# EasyEDA Pro project P3+KG.epro, schematic Schematic1
Board Name: Board1; Create Date: 2026-05-26; Page Name: P1; Project Name: P3; Schematic Name: Schematic1; Update Date: 2026-05-27; Company: 嘉立创EDA; Page Size: A4; Version: V1.0
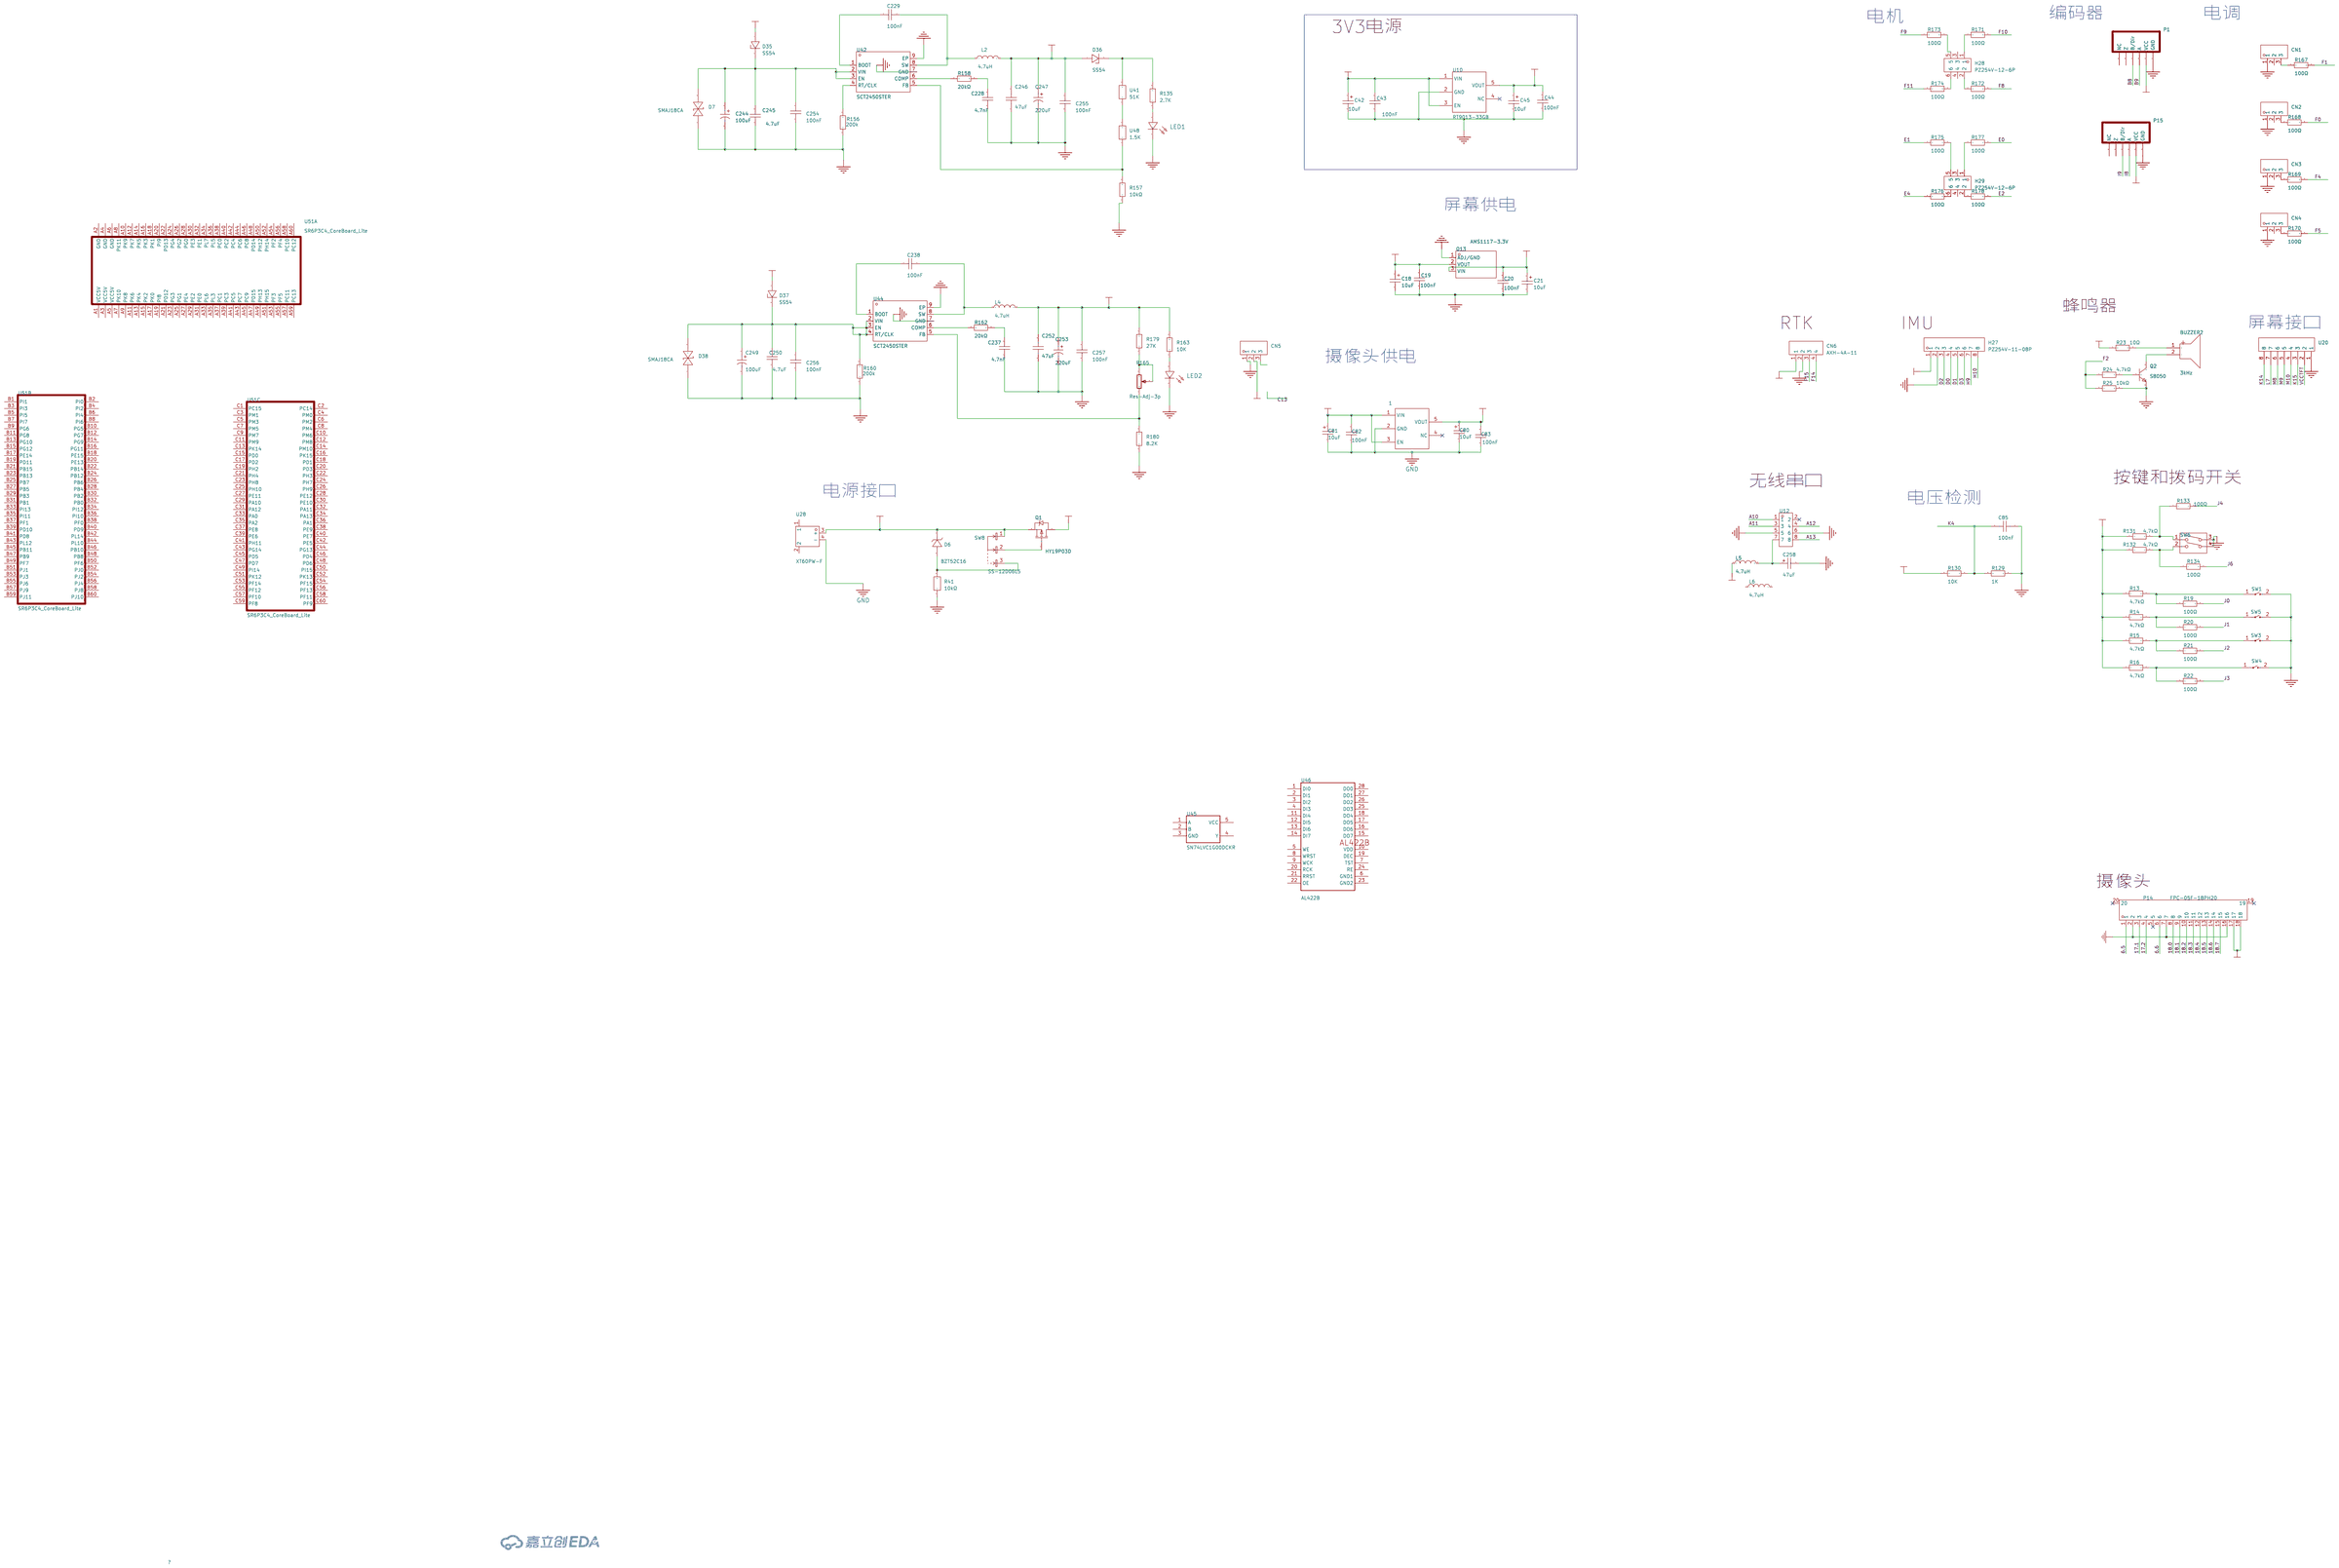
[diagram p0: schematic sheet]

## Parts
1  RT9013-33GB  [SOT-23-5_L3.0-W1.7-P0.95-LS2.8-BL]
BUZZER2  3kHz  [BUZ-TH_BD9.0-P5.00-D0.6-FD]
C18  10uF  [CAP-SMD_L3.2-W1.6-RD-C7171]
C19  100nF  [C0805]
C20  100nF  [C0805]
C21  10uF  [CAP-SMD_L3.2-W1.6-RD-C7171]
C42  10uF  [CAP-SMD_L3.2-W1.6-RD-C7171]
C43  100nF  [C0805]
C44  100nF  [C0805]
C45  10uF  [CAP-SMD_L3.2-W1.6-RD-C7171]
C80  10uF  [CAP-SMD_L3.2-W1.6-RD-C7171]
C81  10uF  [CAP-SMD_L3.2-W1.6-RD-C7171]
C82  100nF  [C0805]
C83  100nF  [C0805]
C85  100nF  [C0603]
C228  4.7nF  [C0603]
C229  100nF  [C0805]
C237  4.7nF  [C0603]
C238  100nF  [C0805]
C244  100uF  [CAP-TH_BD8.0-P3.50-D0.5-FD]
C245  4.7uF  [C1206]
C246  47uF  [C1206]
C247  220uF  [CAP-TH_BD6.3-P2.50-D0.5-FD]
C249  100uF  [CAP-TH_BD8.0-P3.50-D0.5-FD]
C250  4.7uF  [C1206]
C252  47uF  [C1206]
C253  220uF  [CAP-TH_BD6.3-P2.50-D0.5-FD]
C254  100nF  [C0805]
C255  100nF  [C0805]
C256  100nF  [C0805]
C257  100nF  [C0805]
C258  47uF  [CASE-B_3528]
CN1  ZX-XH2.54-3PZZ  [CONN-TH_3P-P2.54_2501S-3P]
CN2  ZX-XH2.54-3PZZ  [CONN-TH_3P-P2.54_2501S-3P]
CN3  ZX-XH2.54-3PZZ  [CONN-TH_3P-P2.54_2501S-3P]
CN4  ZX-XH2.54-3PZZ  [CONN-TH_3P-P2.54_2501S-3P]
CN5  ZX-XH2.54-3PZZ  [CONN-TH_3P-P2.54_2501S-3P]
CN6  AXH-4A-11  [CONN-TH_KH-XH-4A-Z]
D6  BZT52C16  [SOD-123_L2.7-W1.6-LS3.7-RD]
D7  SMAJ18CA  [SMA_L4.4-W2.6-LS5.0-BI]
D35  SS54  [SMA_L4.3-W2.6-LS5.0-FD]
D36  SS54  [SMA_L4.3-W2.6-LS5.0-FD]
D37  SS54  [SMA_L4.3-W2.6-LS5.0-FD]
D38  SMAJ18CA  [SMA_L4.4-W2.6-LS5.0-BI]
H27  PZ254V-11-08P  [HDR-TH_8P-P2.54-V-M]
H28  PZ254V-12-6P  [HDR-TH_6P-P2.54-V-M-R2-C3-S2.54]
H29  PZ254V-12-6P  [HDR-TH_6P-P2.54-V-M-R2-C3-S2.54]
L2  4.7uH  [IND-SMD_L7.3-W6.6_YSPI07XX]
L4  4.7uH  [IND-SMD_L7.3-W6.6_YSPI07XX]
L5  4.7uH  [IND-SMD_L4.6-W4.1-A]
L6  4.7uH  [IND-SMD_L2.5-W2.0_SLW252012P]
LED1  -  [LED_0603]
LED2  -  [LED_0603]
P1  GH1.25-6P  [ECD-GH1.25-6P-SV]
P14  FPC-05F-18PH20  [FPC-SMD_18P-P0.50_FPC-05F-18PH20]
P15  GH1.25-6P  [ECD-GH1.25-6P-SV]
Q1  HY19P03D  [TO-252-2_L6.6-W6.1-P4.57-LS9.9-TL-CW]
Q2  S8050  [SOT-23-3_L2.9-W1.3-P1.90-LS2.3-BR]
Q13  AMS1117-3.3V  [SOT-89-3_L4.5-W2.5-P1.50-LS4.2-BR]
R13  4.7kΩ  [R0603]
R14  4.7kΩ  [R0603]
R15  4.7kΩ  [R0603]
R16  4.7kΩ  [R0603]
R19  100Ω  [R0603]
R20  100Ω  [R0603]
R21  100Ω  [R0603]
R22  100Ω  [R0603]
R23  10Ω  [R0603]
R24  4.7kΩ  [R0603]
R25  10kΩ  [R0603]
R41  10kΩ  [R0603]
R129  1K  [R0603]
R130  10K  [R0603]
R131  4.7kΩ  [R0603]
R132  4.7kΩ  [R0603]
R133  100Ω  [R0603]
R134  100Ω  [R0603]
R135  2.7K  [R0603]
R156  200k  [R0603]
R157  10kΩ  [R0603]
R158  20kΩ  [R0603]
R160  200k  [R0603]
R162  20kΩ  [R0603]
R163  10K  [R0603]
R165  50K  [RESPOT3296W]
R167  100Ω  [R0603]
R168  100Ω  [R0603]
R169  100Ω  [R0603]
R170  100Ω  [R0603]
R171  100Ω  [R0603]
R172  100Ω  [R0603]
R173  100Ω  [R0603]
R174  100Ω  [R0603]
R175  100Ω  [R0603]
R176  100Ω  [R0603]
R177  100Ω  [R0603]
R178  100Ω  [R0603]
R179  27K  [R0603]
R180  8.2K  [R0603]
SW1  K2-1107ST-A1SW-06  [SW-SMD_L6.0-W3.6-LS8.0]
SW3  K2-1107ST-A1SW-06  [SW-SMD_L6.0-W3.6-LS8.0]
SW4  K2-1107ST-A1SW-06  [SW-SMD_L6.0-W3.6-LS8.0]
SW5  K2-1107ST-A1SW-06  [SW-SMD_L6.0-W3.6-LS8.0]
SW6  DSWB02LHGET  [SW-TH_DSWB02LHGET]
SW8  SS-12D06L5  [SW-TH_3P-P4.70_L11.1-W12.7]
U10  RT9013-33GB  [SOT-23-5_L3.0-W1.7-P0.95-LS2.8-BL]
U12  PM254-2-04-W-8.5  [HDR-TH_8P-P2.54-H-F-R2-C4-W8.5]
U20  -  [HDR-TH_8P-P2.54-V-F-1]
U28  XT60PW-F  [TH_2P-XT60PW-F]
U41  51K  [R0603]
U42  SCT2450STER  [ESOP-8_L4.9-W3.9-P1.27-LS6.0-BL-EP]
U44  SCT2450STER  [ESOP-8_L4.9-W3.9-P1.27-LS6.0-BL-EP]
U45  SN74LVC1G00DCKR  [SOT-353]
U46  AL422B  [SOP-28]
U48  1.5K  [R0603]
U51  SR6P3C4_CoreBoard_Lite  [SR6P3C4_CoreBoard_Lite]  (sections 1,2,3)

## Library data of the parts
1 = RT9013-33GB: 输出类型:固定;输出极性:正;输出通道数:1;最大输入电压:5.5V;输出电压:3.3V;压差:400mV@(500mA);静态电流(地电流):-;输出电流:500mA;电源纹波抑制比(PSRR):50dB@(10kHz);噪声:-;特性:-;; LCSC Part Name: 正 Vin=5.5V Vout=3.3V 500mA 50dB@(10kHz); Supplier Part: C47773; Manufacturer: RICHTEK(立锜); Supplier Footprint: SOT-23-5; JLCPCB Part Class: Extended Part; Datasheet: https://atta.szlcsc.com/upload/public/pdf/source/20150504/1457707282459.pdf; Supplier: LCSC; Output Type: 固定; Output Polarity: 正; Maximum Input Voltage: 5.5V; Output Voltage: 3.3V; Dropout Voltage: 400mV@(500mA); Output Current: 500mA; Power Supply Rejection Ratio (PSRR): 50dB@(10kHz)
BUZZER2 = HNB09A03: 驱动方式:有源(内含驱动线路);构造类型:电磁式;频率:3kHz;声压(SPL):85dB@10cm;; LCSC Part Name: 电磁式有源一体蜂鸣器HNB09A03; Supplier Part: C96102; Manufacturer: 华能; Supplier Footprint: 插件,D=9mm; JLCPCB Part Class: 扩展库; Datasheet: https://atta.szlcsc.com/upload/public/pdf/source/20170522/1495448326172.pdf; Supplier: LCSC; Oscillator Circuit: 有源(内含驱动线路); Technology Type: 电磁式; Operating Voltage: 1.5V~4.5V; Current Consumption: 30mA; Sound Pressure Level (SPL): 85dB@10cm; Diameter (φD): 9mm; Height: 5.5mm; Operating Temperature: -20℃~+70℃
C18 C21 C42 C45 C80 C81 = TAJA106K016RNJ: 容值:10uF;精度:±10%;额定电压:16V;等效串联电阻:3Ω@100kHz;; LCSC Part Name: 10uF ±10% 16V; Supplier Part: C7171; Manufacturer: Kyocera AVX; Supplier Footprint: CASE-A-3216; JLCPCB Part Class: 基础库; Datasheet: https://atta.szlcsc.com/upload/public/pdf/source/20160107/1457707750344.pdf; Supplier: LCSC; Tolerance: ±10%; Rated Voltage: 16V; Equivalent Series Resistance(ESR): 3Ω@100kHz; Operating Temperature: -55℃~+125℃
C19 C20 C43 C44 = CC0805KRX7R9BB104: 容值:100nF;精度:±10%;额定电压:50V;材质(温度系数):X7R;; LCSC Part Name: 100nF ±10% 50V; Supplier Part: C49678; Manufacturer: YAGEO(国巨); Supplier Footprint: 0805; JLCPCB Part Class: 基础库; Datasheet: https://atta.szlcsc.com/upload/public/pdf/source/20180224/C181747_15194369449651363981.pdf; Supplier: LCSC; Tolerance: ±10%; Voltage Rated: 50V; Temperature Coefficient: X7R
C82 C83 = 0805B103K500NT_C52278: 容值:10nF;精度:±10%;额定电压:50V;材质(温度系数):X7R;; LCSC Part Name: 10nF ±10% 50V; Supplier Part: C52278; Manufacturer: FH(风华); Manufacturer Part: 0805B103K500NT; Supplier Footprint: 0805; JLCPCB Part Class: Extended Part; Datasheet: https://atta.szlcsc.com/upload/public/pdf/source/20200305/C486355_26A10D38EF8C2A5C37091D0039909270.pdf; Supplier: LCSC; Tolerance: ±10%; Voltage Rated: 50V; Temperature Coefficient: X7R
C85 = CAP_0603: Supplier Footprint: 0603
C228 C237 = CL10B472KB8NNNC: 容值:4.7nF;精度:±10%;额定电压:50V;温度系数:X7R;; LCSC Part Name: 4.7nF ±10% 50V; Supplier Part: C1621; Manufacturer: SAMSUNG(三星); Supplier Footprint: 0603; JLCPCB Part Class: 扩展库; Datasheet: https://item.szlcsc.com/datasheet/CL10B472KB8NNNC/1973.html; Supplier: LCSC; Tolerance: ±10%; Voltage Rating: 50V; Temperature Coefficient: X7R
C229 C238 C254-C257 = 0805B104K500NT: 容值:100nF;精度:±10%;额定电压:50V;材质(温度系数):X7R;; LCSC Part Name: 100nF ±10% 50V; Supplier Part: C38141; Manufacturer: FH(风华); Supplier Footprint: 0805; JLCPCB Part Class: 扩展库; Datasheet: https://atta.szlcsc.com/upload/public/pdf/source/20200305/C486355_26A10D38EF8C2A5C37091D0039909270.pdf; Supplier: LCSC; Tolerance: ±10%; Voltage Rated: 50V; Temperature Coefficient: X7R
C244 C249 = ERG50V100M8X12: 容值:100uF;精度:±20%;额定电压:50V;纹波电流:680mA@100kHz;等效串联电阻(ESR):120mΩ@100kHz;; LCSC Part Name: 100uF ±20% 50V; Supplier Part: C47344183; Manufacturer: JIERR(捷而瑞); Supplier Footprint: 插件,D8xL12mm; JLCPCB Part Class: 扩展库; Datasheet: https://item.szlcsc.com/datasheet/ERG50V100M8X12/49556624.html; Supplier: LCSC; Tolerance: ±20%; Voltage Rating: 50V; Ripple Current: 680mA@100kHz; Equivalent Series Resistance(ESR): 120mΩ@100kHz; Pin Spacing: 3.5mm; Diameter: 8mm; Height - Seated (Max): 12mm; Lifetime: 2000hrs@105℃; Operating Temperature: -40℃~+105℃
C245 C250 = 1206B475K500NT: 容值:4.7uF;精度:±10%;额定电压:50V;温度系数:X7R;; LCSC Part Name: 4.7uF ±10% 50V; Supplier Part: C29823; Manufacturer: FH(风华); Supplier Footprint: 1206; JLCPCB Part Class: 基础库; Datasheet: https://item.szlcsc.com/datasheet/1206B475K500NT/30577.html; Supplier: LCSC; Tolerance: ±10%; Voltage Rating: 50V; Temperature Coefficient: X7R
C246 C252 = HGC1206R5476M250NSPJ: 容值:47uF;精度:±20%;额定电压:25V;温度系数:X5R;; LCSC Part Name: 47uF ±20% 25V; Supplier Part: C22367835; Manufacturer: Chinocera(华瓷); Supplier Footprint: 1206; JLCPCB Part Class: 扩展库; Datasheet: https://item.szlcsc.com/datasheet/HGC1206R5476M250NSPJ/23841140.html; Supplier: LCSC; Tolerance: ±20%; Voltage Rating: 25V; Temperature Coefficient: X5R
C247 C253 = ERG25V220M6X11: 容值:220uF;精度:±20%;额定电压:25V;纹波电流:510mA@100kHz;等效串联电阻(ESR):130mΩ@100kHz;; LCSC Part Name: 220uF ±20% 25V; Supplier Part: C47344177; Manufacturer: JIERR(捷而瑞); Supplier Footprint: 插件,D6.3xL11mm; JLCPCB Part Class: 扩展库; Datasheet: https://item.szlcsc.com/datasheet/ERG25V220M6X11/49556618.html; Supplier: LCSC; Tolerance: ±20%; Voltage Rating: 25V; Ripple Current: 510mA@100kHz; Equivalent Series Resistance(ESR): 130mΩ@100kHz; Pin Spacing: 2.5mm; Diameter: 6mm; Height - Seated (Max): 11mm; Lifetime: 2000hrs@105℃; Operating Temperature: -40℃~+105℃
C258 = TAJB476K010RNJ: 容值:47uF;精度:±10%;额定电压:10V;等效串联电阻:1Ω@100kHz;; LCSC Part Name: 47uF ±10% 10V; Supplier Part: C22036; Manufacturer: Kyocera AVX; Supplier Footprint: CASE-B-3528; JLCPCB Part Class: 扩展库; Datasheet: https://atta.szlcsc.com/upload/public/pdf/source/20160107/1457707750344.pdf; Supplier: LCSC; Tolerance: ±10%; Rated Voltage: 10V; Equivalent Series Resistance(ESR): 1Ω@100kHz; Operating Temperature: -55℃~+125℃
CN1-CN5 = ZX-XH2.54-3PZZ: 插针结构:1x3P;间距:2.5mm;安装方式:直插;参考系列:XH;总PIN数:3P;排数:1;每排PIN数:3;行距:-;额定电流:3A;触头材质:黄铜;触头镀层:锡;工作温度:-25℃~+85℃;; LCSC Part Name: 1x3P 间距:2.5mm 直插 系列:XH; Supplier Part: C7429633; Manufacturer: Megastar(兆星); Supplier Footprint: 插件,P=2.5mm; JLCPCB Part Class: 扩展库; Datasheet: https://item.szlcsc.com/datasheet/ZX-XH2.54-3PZZ/8427550.html; Supplier: LCSC; Pins Structure: 1x3P; Pitch: 2.5mm; Mounting Type: 直插; Reference Series: XH; Number of Pins: 3P; Number of Rows: 1; Number of PINs Per Row: 3; Current Rating: 3A; Contact Material: 黄铜; Contact Plating: 锡; Operating Temperature: -25℃~+85℃; Voltage Rating: 250V; Plastic Material: PA66; Flame Retardant Rating: UL94V-0; Color: 白色; Z-Height of the Board: 7mm; X-Length of Bottom Edge on Board (Spacing Line): 10mm; Y-Width of Bottom Edge on Board: 5.9mm
CN6 = AXH-4A-11: 插针结构:1x4P;间距:2.5mm;安装方式:直插;参考系列:XH;总PIN数:4P;排数:1;每排PIN数:4;行距:2.5mm;额定电流:2A;触头材质:黄铜;触头镀层:锡;工作温度:-25℃~+85℃;; LCSC Part Name: 1x4P 间距:2.5mm 直插 系列:XH; Supplier Part: C42422439; Manufacturer: JXTCONN(聚兴泰); Supplier Footprint: 插件,P=2.54mm; JLCPCB Part Class: 扩展库; Datasheet: https://item.szlcsc.com/datasheet/AXH-4A-11/44442050.html; Supplier: LCSC; Pins Structure: 1x4P; Pitch: 2.5mm; Mounting Type: 直插; Reference Series: XH; Number of Pins: 4P; Number of Rows: 1; Number of PINs Per Row: 4; Row Spacing: 2.5mm; Current Rating: 2A; Contact Material: 黄铜; Contact Plating: 锡; Operating Temperature: -25℃~+85℃; Voltage Rating: 250V; Plastic Material: PA66; Flame Retardant Rating: UL94V-0; Color: 白色; Z-Height of the Board: 7mm; X-Length of Bottom Edge on Board (Spacing Line): 12.5mm; Y-Width of Bottom Edge on Board: 5.9mm
D6 = BZT52C16_C19077413: 二极管配置:独立式;稳压值(标称值):16V;稳压值(范围):15.2V~16.8V;功率(Pd):500mW;; Supplier Part: C19077413; Manufacturer: 宏迦橙; Supplier Footprint: SOD-123; JLCPCB Part Class: 扩展库; Datasheet: https://atta.szlcsc.com/upload/public/pdf/source/20231117/6E01C14CCA1A38C68A5225952E4BCE14.pdf; Supplier: LCSC; Diode Configuration: 独立式; Zener Voltage (Nom): 16V; Reverse Leakage Current (Ir): 100nA@11.2V; Zener Voltage (Range): 15.2V~16.8V; Power Dissipation: 500mW; Zener Impedance (Zzt): 45Ω
D7 D38 = SMAJ18CA_C151240: 极性:双向;反向截止电压(Vrwm):18V;钳位电压:29.2V;峰值脉冲电流(Ipp):13.7A@10/1000us;峰值脉冲功率(Ppp):400W@10/1000us;击穿电压:22.1V;; LCSC Part Name: 双向TVS 18V截止 峰值脉冲电流：13.7A@10/1000us; Supplier Part: C151240; Manufacturer: Littelfuse(美国力特); Supplier Footprint: DO-214AC(SMA); JLCPCB Part Class: 扩展库; Datasheet: https://item.szlcsc.com/datasheet/SMAJ18CA/162580.html; Supplier: LCSC; Polarity: 双向; Reverse Stand-Off Voltage (Vrwm): 18V; Clamping Voltage: 29.2V; Peak Pulse Current (Ipp): 13.7A@10/1000us; Peak Pulse Power Dissipation (Ppp): 400W@10/1000us; Voltage - Breakdown: 22.1V; Reverse Leakage Current (Ir): 1uA; Operating Temperature: -65℃~+150℃; level of protection: IEC 61000-4-4；IEC 61000-4-2; Type: TVS
D35-D37 = SS54_C7420369: 二极管配置:独立式;正向压降(Vf):550mV@5.0A;直流反向耐压(Vr):40V;整流电流:5A;; LCSC Part Name: 电压:40V 电流:5A; Supplier Part: C7420369; Manufacturer: 宏迦橙; Supplier Footprint: SMA(DO-214AC); JLCPCB Part Class: 扩展库; Datasheet: https://atta.szlcsc.com/upload/public/pdf/source/20230828/254C3882F8647358AD9F60DD73611B5E.pdf; Supplier: LCSC; Diode Configuration: 独立式; Forward Voltage (Vf@If): 550mV@5.0A; Reverse Voltage (Vr): 40V; Rectified Current: 5A; Reverse Leakage Current (Ir): 50uA@40V; Voltage - Forward(Vf@If): 550mV@5.0A; Voltage - DC Reverse(Vr): 40V; Current - Rectified: 5A; Operating Junction Temperature Range: -55℃~+125℃; Non-Repetitive Peak Forward Surge Current: 120A
H27 = PZ254V-11-08P: 插针结构:1x8P;间距:2.54mm;行距:-;圆针/方针:方针;安装方式:直插;排数:单排;总PIN位数:8P;额定电流:3A;额定电压:250V;配合针长度:6mm;塑高:2.5mm;端接针长度:3mm;触头材质:黄铜;触头镀层:-;工作温度:-40℃~+105℃;颜色:黑色;; LCSC Part Name: 1x8P 间距:2.54mm 方针 直插; Supplier Part: C492407; Manufacturer: XFCN(兴飞); Supplier Footprint: 插件,P=2.54mm; JLCPCB Part Class: 扩展库; Datasheet: https://item.szlcsc.com/datasheet/PZ254V-11-08P/502963.html; Supplier: LCSC; Pin Structure: 1x8P; Pitch: 2.54mm; Circluar Pins/Square Pins: 方针; Mounting Type: 直插; Number of Rows: 单排; Number of Pins: 8P; Current Rating: 3A; Voltage Rating (Max): 250V; Length of Mating Pin: 6mm; Insulation Height: 2.5mm; Length of End Connection Pin: 3mm; Contact Material: 黄铜; Operating Temperature: -40℃~+105℃; Color: 黑色
H28 H29 = PZ254V-12-6P: 插针结构:2x3P;间距:2.54mm;行距:2.54mm;圆针/方针:方针;安装类型:直插;排数:双排;总PIN位数:6P;额定电流:-;额定电压:-;配合针长度:6mm;塑高:2.5mm;端接针长度:3mm;触头材质:黄铜;触头镀层:-;工作温度范围:-40℃~+105℃;颜色:黑色;; LCSC Part Name: 间距:2.54mm 2x3P 直插 方针; Supplier Part: C492420; Manufacturer: XFCN(兴飞); Supplier Footprint: 插件,P=2.54mm; JLCPCB Part Class: 扩展库; Datasheet: https://atta.szlcsc.com/upload/public/pdf/source/20200309/C492420_BAECB307B001054C09D200388220EAE6.pdf; Supplier: LCSC; Pin Structure: 2x3P; Pitch: 2.54mm; Row Spacing: 2.54mm; Circluar Pins/Square Pins: 方针; Mounting Type: 直插; Number of Rows: 双排; Number of Pins: 6P; Length of Mating Pin: 6mm; Insulation Height: 2.5mm; Length of End Connection Pin: 3mm; Contact Material: 黄铜; Operating Temperature Range: -40℃~+105℃; Color: 黑色
L2 L4 = SRG0624-4R7-M: 电感值:4.7uH;精度:±20%;额定电流:4.5A;饱和电流(Isat):8A;类型:一体成型电感;; LCSC Part Name: 高电流功率电感器，无卤素，采用金属粉末磁芯材料，磁屏蔽、低电磁干扰，高载流能力、低磁芯损耗，符合RoHS标准; Supplier Part: C53462981; Manufacturer: JIERR(捷而瑞); Supplier Footprint: SMD,7.3x6.6mm; JLCPCB Part Class: 扩展库; Datasheet: https://item.szlcsc.com/datasheet/SRG0624-4R7-M/56628176.html; Supplier: LCSC; Tolerance: ±20%; Current Rating: 4.5A; Current - Saturation(Isat): 8A; DC Resistance(DCR): 50mΩ; Type: 一体成型电感
L5 = SRG0420-4R7-M: 电感值:4.7uH;精度:±20%;额定电流:3A;饱和电流(Isat):3.5A;类型:一体成型电感;; LCSC Part Name: 4.7μH ±20% 3.5A; Supplier Part: C53462918; Manufacturer: JIERR(捷而瑞); Supplier Footprint: SMD,4.6x4.1mm; JLCPCB Part Class: 扩展库; Datasheet: https://item.szlcsc.com/datasheet/SRG0420-4R7-M/56628163.html; Supplier: LCSC; Tolerance: ±20%; Current Rating: 3A; Current - Saturation(Isat): 3.5A; DC Resistance(DCR): 105mΩ; Type: 一体成型电感
L6 = PCT252012-4R7-M: 电感值:4.7uH;精度:±20%;额定电流:1.6A;饱和电流(Isat):2.1A;类型:一体成型电感;; LCSC Part Name: 4.7μH ±20% 2.1A; Supplier Part: C54557087; Manufacturer: JIERR(捷而瑞); Supplier Footprint: 1008; JLCPCB Part Class: 扩展库; Datasheet: https://item.szlcsc.com/datasheet/PCT252012-4R7-M/57921675.html; Supplier: LCSC; Tolerance: ±20%; Current Rating: 1.6A; Current - Saturation(Isat): 2.1A; DC Resistance(DCR): 220mΩ; Type: 一体成型电感
LED1 LED2 = LED_0603-R: Supplier Footprint: 0603
P1 P15 = GH1.25-6P-SV新编码器主板端-立式: 逐飞1024线编码器GH1.25-6P主板端 立式; componentDisplayMode: -1; Revision: V1.0
P14 = FPC-05F-18PH20: 锁定特性:翻盖式;触点类型:下接;触点数量:18P;间距:0.5mm;安装类型:卧贴;工作温度范围:-25℃~+85℃;; LCSC Part Name: 间距:0.5mm P数:18P 翻盖式 下接; Supplier Part: C2856802; Manufacturer: XUNPU(讯普); Supplier Footprint: SMD,P=0.5mm,卧贴; JLCPCB Part Class: 扩展库; Datasheet: https://atta.szlcsc.com/upload/public/pdf/source/20210922/C2856802_2A845D1961F33AEC1ED22CECB292335F.pdf; Supplier: LCSC; Locking Feature: 翻盖式; Contact Type: 下接; Number of Contacts: 18P; Pitch: 0.5mm; Mounting Type: 卧贴; FFC, FCB Thickness: 0.3mm; Height Above Board: 2mm; Operating Temperature Range: -25℃~+85℃
Q1 = HY19P03D: 类型:P沟道;漏源电压(Vdss):30V;连续漏极电流(Id):90A;功率(Pd):50W;导通电阻(RDS(on)@Vgs,Id):6mΩ@10V,45A;阈值电压(Vgs(th)@Id):3V@250uA;; LCSC Part Name: P沟道 耐压:30V 电流:90A; Supplier Part: C122492; Manufacturer: HUAYI(华羿微); Supplier Footprint: TO-252-2; JLCPCB Part Class: 扩展库; Datasheet: https://atta.szlcsc.com/upload/public/pdf/source/20170728/C122492_1501225751911848809.pdf; Supplier: LCSC; Type: P沟道; Drain Source Voltage (Vdss): 30V; Continuous Drain Current (Id): 90A; Power Dissipation (Pd): 50W; Drain Source On Resistance (RDS(on)@Vgs,Id): 6mΩ@10V,45A; Gate Threshold Voltage (Vgs(th)@Id): 3V@250uA
Q2 = S8050_C20069125: 晶体管类型:NPN;集电极电流(Ic):500mA;集射极击穿电压(Vceo):25V;功率(Pd):300mW;直流电流增益(hFE@Ic,Vce):120@50mA,1.0V;; LCSC Part Name: NPN 电流:500mA 耐压:25V; Supplier Part: C20069125; Manufacturer: 宏迦橙; Supplier Footprint: SOT-23; JLCPCB Part Class: 扩展库; Datasheet: https://atta.szlcsc.com/upload/public/pdf/source/20240403/2D78449C96B6E27F13BF8BDF79E27159.pdf; Supplier: LCSC; Transistor Type: NPN; Collector Current (Ic): 500mA; Collector-Emitter Breakdown Voltage (Vceo): 25V; Power Dissipation (Pd): 300mW; DC Current Gain (hFE@Ic,Vce): 120@50mA,1.0V; Transition Frequency (fT): 100MHz; Collector Cut-Off Current (Icbo): 100nA; Collector-Emitter Saturation Voltage (VCE(sat)@Ic,Ib): 600mV@500mA,50mA; Operating Temperature: -55℃~+150℃
Q13 = AMS1117-3.3V_C5120796: 输出类型:固定;最大输入电压:18V;输出电压:3.3V;最大输出电流:1A;输出极性:正极;; LCSC Part Name: 输入18V 输出3.3V 1A; Supplier Part: C5120796; Manufacturer: MSKSEMI(美森科); Supplier Footprint: SOT-89; JLCPCB Part Class: 扩展库; Datasheet: https://atta.szlcsc.com/upload/public/pdf/source/20231123/6117526697EB8BF6175FDEEBA0877266.pdf; Supplier: LCSC; Output Type: 固定; Maximum Input Voltage: 18V; Output Voltage: 3.3V; MAX Output Current: 1A; Dropout Voltage: 1.4V@(1A); standby current: 12mA; Operating Temperature: 0℃~+125℃; Output Polarity: 正极; Number of Outputs: 1
R13-R16 R24 R131 R132 = 0603WAF4701T5E: 电阻类型:厚膜电阻;阻值:4.7kΩ;精度:±1%;功率:100mW;最大工作电压:75V;温度系数:±100ppm/℃;; LCSC Part Name: 4.7kΩ ±1% 100mW 厚膜电阻; Supplier Part: C23162; Manufacturer: UNI-ROYAL(厚声); Supplier Footprint: 0603; JLCPCB Part Class: 基础库; Datasheet: https://atta.szlcsc.com/upload/public/pdf/source/20200306/C422600_1E6D84923E4A46A82E41ADD87F860B5C.pdf; Supplier: LCSC; Type: 厚膜电阻; Tolerance: ±1%; Power(Watts): 100mW; Overload Voltage (Max): 75V; Temperature Coefficient: ±100ppm/℃; Operating Temperature Range: -55℃~+155℃
R19-R22 R133 R134 = 0603WAF4700T5E: 电阻类型:厚膜电阻;阻值:470Ω;精度:±1%;功率:100mW;最大工作电压:75V;温度系数:±100ppm/℃;; LCSC Part Name: 470Ω ±1% 100mW 厚膜电阻; Supplier Part: C23179; Manufacturer: UNI-ROYAL(厚声); Supplier Footprint: 0603; JLCPCB Part Class: 基础库; Datasheet: https://atta.szlcsc.com/upload/public/pdf/source/20200306/C422600_1E6D84923E4A46A82E41ADD87F860B5C.pdf; Supplier: LCSC; Type: 厚膜电阻; Tolerance: ±1%; Power(Watts): 100mW; Overload Voltage (Max): 75V; Temperature Coefficient: ±100ppm/℃; Operating Temperature Range: -55℃~+155℃
R23 = 0603WAF100JT5E: 电阻类型:厚膜电阻;阻值:10Ω;精度:±1%;功率:100mW;最大工作电压:75V;温度系数:±400ppm/℃;; LCSC Part Name: 10Ω ±1% 100mW 厚膜电阻; Supplier Part: C22859; Manufacturer: UNI-ROYAL(厚声); Supplier Footprint: 0603; JLCPCB Part Class: 基础库; Datasheet: https://atta.szlcsc.com/upload/public/pdf/source/20200306/C422600_1E6D84923E4A46A82E41ADD87F860B5C.pdf; Supplier: LCSC; Type: 厚膜电阻; Tolerance: ±1%; Power(Watts): 100mW; Overload Voltage (Max): 75V; Temperature Coefficient: ±400ppm/℃; Operating Temperature Range: -55℃~+155℃
R25 = 0603WAF1001T5E: 电阻类型:厚膜电阻;阻值:1kΩ;精度:±1%;功率:100mW;最大工作电压:75V;温度系数:±100ppm/℃;; LCSC Part Name: 1kΩ ±1% 100mW 厚膜电阻; Supplier Part: C21190; Manufacturer: UNI-ROYAL(厚声); Supplier Footprint: 0603; JLCPCB Part Class: 基础库; Datasheet: https://atta.szlcsc.com/upload/public/pdf/source/20200306/C422600_1E6D84923E4A46A82E41ADD87F860B5C.pdf; Supplier: LCSC; Type: 厚膜电阻; Tolerance: ±1%; Power(Watts): 100mW; Overload Voltage (Max): 75V; Temperature Coefficient: ±100ppm/℃; Operating Temperature Range: -55℃~+155℃
R41 = FRC0603J103TS: 电阻类型:厚膜电阻;阻值:10kΩ;精度:±5%;功率:100mW;最大工作电压:75V;温度系数:±100ppm/℃;; LCSC Part Name: 10kΩ ±5% 100mW 厚膜电阻; Supplier Part: C2930027; Manufacturer: FOJAN(富捷); Supplier Footprint: 0603; JLCPCB Part Class: 扩展库; Datasheet: https://atta.szlcsc.com/upload/public/pdf/source/20211221/925EC7D7225764EE0046F22065062C87.pdf; Supplier: LCSC; Type: 厚膜电阻; Tolerance: ±5%; Power(Watts): 100mW; Overload Voltage (Max): 75V; Temperature Coefficient: ±100ppm/℃; Operating Temperature Range: -55℃~+155℃
R129 R130 R135 R163 R179 R180 = Res_0603: Supplier Footprint: 0603
R156 R160 = Res_0805: Supplier Footprint: 0805
R157 = 0603WAF1002T5E: 电阻类型:厚膜电阻;阻值:10kΩ;精度:±1%;功率:100mW;最大工作电压:75V;温度系数:±100ppm/℃;; LCSC Part Name: 厚膜电阻 10kΩ ±1% 100mW; Supplier Part: C25804; Manufacturer: UNI-ROYAL(厚声); Supplier Footprint: 0603; JLCPCB Part Class: 基础库; Datasheet: https://atta.szlcsc.com/upload/public/pdf/source/20200306/C422600_1E6D84923E4A46A82E41ADD87F860B5C.pdf; Supplier: LCSC; Type: 厚膜电阻; Tolerance: ±1%; Power(Watts): 100mW; Overload Voltage (Max): 75V; Temperature Coefficient: ±100ppm/℃; Operating Temperature Range: -55℃~+155℃
R158 R162 = 0603WAF2002T5E: 电阻类型:厚膜电阻;阻值:20kΩ;精度:±1%;功率:100mW;工作电压:75V;温度系数:±100ppm/℃;; LCSC Part Name: 20kΩ ±1% 100mW 厚膜电阻; Supplier Part: C4184; Manufacturer: UNI-ROYAL(厚声); Supplier Footprint: 0603; JLCPCB Part Class: 基础库; Datasheet: https://item.szlcsc.com/datasheet/0603WAF2002T5E/4591.html; Supplier: LCSC; Type: 厚膜电阻; Tolerance: ±1%; Power(Watts): 100mW; Voltage-Supply(Max): 75V; Temperature Coefficient: ±100ppm/℃; Operating Temperature: -55℃~+155℃
R165 = Res-Adj-3p: 可调电阻; componentDisplayMode: -1; Revision: V1.0; Footprint Name: RESPOT3386P
R167-R178 = RC0603FR-07100RL: 电阻类型:厚膜电阻;阻值:100Ω;精度:±1%;功率:100mW;最大工作电压:75V;温度系数:±100ppm/℃;; LCSC Part Name: 厚膜电阻 100Ω ±1% 100mW; Supplier Part: C105588; Manufacturer: YAGEO(国巨); Supplier Footprint: 0603; JLCPCB Part Class: 扩展库; Datasheet: https://atta.szlcsc.com/upload/public/pdf/source/20180316/70C0E2BDAE7FCC62C531A5A58D202EE1.pdf; Supplier: LCSC; Type: 厚膜电阻; Tolerance: ±1%; Power(Watts): 100mW; Overload Voltage (Max): 75V; Temperature Coefficient: ±100ppm/℃; Operating Temperature Range: -55℃~+155℃
SW1 SW3-SW5 = K2-1107ST-A1SW-06: 作用力:90gf;安装方式:立贴;开关长度:6.1mm;开关宽度:3.6mm;开关高度:2.5mm;触点电流:50mA;额定电压:12V;工作寿命:10万次;; LCSC Part Name: 3×6×2.5 进口弹片 有防水膜 灰胶头100G; Supplier Part: C707329; Manufacturer: 韩国韩荣; Supplier Footprint: SMD,6.1x3.6mm; JLCPCB Part Class: 扩展库; Datasheet: https://item.szlcsc.com/datasheet/K2-1107ST-A1SW-06/744451.html; Supplier: LCSC; Operating Force: 90gf; Mounting Type: 立贴; Length: 6.1mm; Width: 3.6mm; Switch Height: 2.5mm; Contact Current: 50mA; Voltage Rating: 12V; Life: 10万次; Operating Temperature: -25℃~+85℃
SW6 = DSWB02LHGET: 类型:平拨,凸起式;电路结构:单刀单掷;开关位数:2位;使用寿命:-;颜色:红色;; LCSC Part Name: 拨码开关,平拨开关,DSWB02LHGET; Supplier Part: C99421; Manufacturer: YE; Supplier Footprint: 插件; JLCPCB Part Class: 扩展库; Datasheet: https://atta.szlcsc.com/upload/public/pdf/source/20230906/EFD9230F686161BBBCD1B62855702D44.pdf; Supplier: LCSC; Type: 平拨,凸起式; Circuit: 单刀单掷; Number of Positions: 2位; Lead Pitch: 2.54mm; Color: 红色
SW8 = SS-12D06L5: 电路结构:单刀双掷;安装方式:-;开关颜色:黑色;额定电流:3A;额定电压:250V;工作寿命:1万次;; LCSC Part Name: 柄长5mm 卧插双档 滑动开关; Supplier Part: C319015; Manufacturer: XKB Connection(中国星坤); Supplier Footprint: 插件,13x6.6mm; JLCPCB Part Class: 扩展库; Datasheet: https://item.szlcsc.com/datasheet/SS-12D06L5/300107.html; Supplier: LCSC; Circuit: 单刀双掷; Actuator Style: 矩形柱状; Termination Style: PC引脚; Length: 12.95mm; Width: 6.6mm; Switch Height: 6.3mm; Actuator Color: 黑色; Current Rating: 3A; Voltage Rating: 250V; Life: 1万次; Operating Temperature: -40℃~+85℃
U10 = RT9013-33GB: 输出类型:固定;最大输入电压:5.5V;输出电压:3.3V;输出电流:500mA;电源纹波抑制比(PSRR):50dB@(10kHz);输出极性:正极;; LCSC Part Name: 输入5.5V 输出3.3V 500mA; Supplier Part: C47773; Manufacturer: RICHTEK(立锜); Supplier Footprint: SOT-23-5; JLCPCB Part Class: Extended Part; Datasheet: https://atta.szlcsc.com/upload/public/pdf/source/20150504/1457707282459.pdf; Supplier: LCSC; Output Type: 固定; Output Polarity: 正极; Number of Outputs: 1; Maximum Input Voltage: 5.5V; Output Voltage: 3.3V; Dropout Voltage: 400mV@(500mA); Output Current: 500mA; Feature: 低ESR；防静电保护；热保护(TSD)；过流保护(OCP)；带使能; Power Supply Rejection Ratio (PSRR): 50dB@(10kHz); standby current: 50uA; Operating Temperature: -40℃~+85℃
U12 = PM254-2-04-W-8.5: 插孔结构:2x4P;间距:2.54mm;行距:2.54mm;圆孔/方孔:方孔;安装方式:弯插;排数:双排;总孔位数:8P;额定电流:3A;额定电压:-;插孔方向:侧面;塑高:8.5mm;触头材质:铜合金;工作温度:-40℃~+105℃;; LCSC Part Name: 2x4P 间距:2.54mm 弯插; Supplier Part: C2897424; Manufacturer: HCTL(华灿天禄); Supplier Footprint: 弯插,P=2.54mm; JLCPCB Part Class: 扩展库; Datasheet: https://item.szlcsc.com/datasheet/PM254-2-04-W-8.5/3142429.html; Supplier: LCSC; Holes Structure: 2x4P; Pitch: 2.54mm; Row Spacing: 2.54mm; Circular Hole / Square Hole: 方孔; Mounting Type: 弯插; Number of Rows: 双排; Number of Positions: 8P; Current Rating: 3A; Holes Direction: 侧面; Insulation Height: 8.5mm; Contact Material: 铜合金; Operating Temperature: -40℃~+105℃
U20 = TFT1.8单
U28 = XT60PW-F: LCSC Part Name: AMASS(艾迈斯)插头连接器锂电池组充电接口 航模电调卧式焊板 母头 XT60PW-F; Supplier Part: C428722; Manufacturer: AMASS(艾迈斯); JLCPCB Part Class: 扩展库; Datasheet: https://item.szlcsc.com/datasheet/XT60PW-F/423834.html; Supplier: LCSC
U41 U48 = FRC0603F1403TS: 电阻类型:厚膜电阻;阻值:140kΩ;精度:±1%;功率:100mW;工作电压:75V;温度系数:±100ppm/℃;; LCSC Part Name: 140kΩ ±1% 100mW 厚膜电阻; Supplier Part: C2933144; Manufacturer: FOJAN(富捷); Supplier Footprint: 0603; JLCPCB Part Class: 扩展库; Supplier: LCSC; Type: 厚膜电阻; Tolerance: ±1%; Power(Watts): 100mW; Voltage-Supply(Max): 75V; Temperature Coefficient: ±100ppm/℃; Operating Temperature: -55℃~+155℃
U42 U44 = SCT2450STER: 功能类型:降压型;工作电压:3.8V~36V;输出电压:800mV~36V;输出电流:5A;输出类型:可调;; LCSC Part Name: 3.8V-36V输入，5A输出，高效率同步降压DC-DC转换器; Supplier Part: C509400; Manufacturer: SCT(芯洲科技); Supplier Footprint: ESOP-8; JLCPCB Part Class: 扩展库; Datasheet: https://item.szlcsc.com/datasheet/SCT2450STER/523158.html; Supplier: LCSC; Function: 降压型; Voltage - Supply: 3.8V~36V; Output Voltage: 800mV~36V; Output Current: 5A; Frequency - Switching: 100kHz~1.1MHz; Operating Temperature: -40℃~+125℃@(TJ); Synchronous Rectifier: 是; Number of Outputs: 1; Topology: 降压式; Quiescent Current: 25uA; Switch tube (built-in/external): 内置; Output Type: 可调
U45 = SN74LVC1G00DCKR: SN74LVC1G00DCKR 与非门; componentDisplayMode: -1
U46 = AL422B: 8路先入先出存储器(fifo); componentDisplayMode: -1; Revision: V1.0
U51 = SR6P3C4_CoreBoard_Lite: 逐飞科技 SR6P3C4_CoreBoard 核心板 BTB全引脚 无下载等引脚; componentDisplayMode: -1; Published: 8-Jun-2000; Revision: July-2002: Re-released for DXP Platform.; Publisher: Altium Limited; Imax: 50mA; DCR: .1m; Price(RMB): 0.000

## Nets
GND: 1.2(GND) C18.2 C19.1 C20.1 C21.2 C42.2 C43.1 C44.1 C45.2 C80.2 C81.2 C82.1 C83.1 C85.1 C228.1 C237.1 C244.2 C245.1 C246.1 C247.2 C249.2 C250.1 C252.1 C253.2 C254.2 C255.2 C256.2 C257.2 C258.2 CN1.1 CN2.1 CN3.1 CN4.1 CN5.1 CN6.2 D7.1 D38.1 H27.2 LED1.1(C) LED2.1(C) P1.1(GND) P14.2 P14.7 P14.16 P15.1(GND) Q2.2(E) Q13.1(ADJ/GND) R25.2 R41.1 R129.1 R156.1 R157.1 R160.1 R180.1 SW1.2 SW3.2 SW4.2 SW5.2 SW6.3 SW6.4 U10.2(GND) U12.5 U12.6 U20.1 U28.4(-) U42.7(GND) U42.9(EP) U44.7(GND) U44.9(EP)
VCC: D6.1(K) Q1.3(S) SW8.1 U28.3(+)
VCC3V3: C44.2 C45.1 H27.1 P1.2(VCC) P15.2(VCC) R13.1 R14.1 R15.1 R16.1 R23.1 R131.1 R132.1 U10.5(VOUT)
VCC5V: 1.1(VIN) 1.3(EN) C20.2 C21.1 C42.1 C43.2 C81.1 C82.2 C246.2 C247.1 C255.1 CN6.1 D36.1(A) L2.2 L5.1 Q13.3(VIN) U10.1(VIN) U10.3(EN)
VCCBAT: D35.1(A) D37.1(A) Q1.2(D) R130.2
VCCCAM: 1.5(VOUT) C80.1 C83.2 P14.17 P14.18
VCCSERVEO: C252.2 C253.1 C257.1 CN5.2 L4.2 R163.2 R179.2
VCCTFT: C18.1 C19.2 Q13.2(VOUT) U20.2
6.5: P14.1
6.6: P14.6
17.1: P14.3
17.2: P14.4
18.0: P14.8
18.1: P14.9
18.2: P14.10
18.3: P14.11
18.4: P14.12
18.5: P14.13
18.6: P14.14
18.7: P14.15
A10: U12.1
A11: U12.3
A12: U12.4
A13: U12.8
B8: P1.4(B/Dir)
B9: P1.3(A)
D0: H27.4
D1: H27.5
D2: H27.3
D3: H27.6
E0: R177.2
E1: R175.1
E2: R178.2
E4: R176.1
F0: R168.2
F1: R167.2
F2: R24.1 R25.1
F4: R169.2
F5: R170.2
F8: R172.2
F9: R173.1
F10: R171.2
F11: R174.1
F14: CN6.4
F15: CN6.3
H9: H27.7
H10: H27.8
I8: P15.3(A)
I9: P15.4(B/Dir)
J0: R19.2
J1: R20.2
J2: R21.2
J3: R22.2
J4: R133.2
J6: R134.2
K4: C85.2 R129.2 R130.1
K14: U20.8
K15: U20.3
L7: U20.7
M8: U20.6
M9: U20.5
M10: U20.4
$1N6511: Q2.1(B) R24.2
$1N6513: BUZZER2.2(-) Q2.3(C)
$1N6514: BUZZER2.1(+) R23.2
$1N6713: R16.2 R22.1 SW4.1
$1N6716: R15.2 R21.1 SW3.1
$1N6719: R14.2 R20.1 SW5.1
$1N6722: R13.2 R19.1 SW1.1
$1N6756: R132.2 R134.1 SW6.2
$1N6757: R131.2 R133.1 SW6.1
$1N6838: Q1.1(G) SW8.2
$1N6840: D6.2(A) R41.2 SW8.3
$1N6859: R156.2 U42.4(RT/CLK)
$1N6860: C229.2 U42.1(BOOT)
$1N6864: C244.1 C245.2 C254.1 D7.2 D35.2(K) U42.2(VIN) U42.3(EN)
$1N6865: R158.1 U42.6(COMP)
$1N6866: C228.2 R158.2
$1N6871: C229.1 L2.1 U42.8(SW)
$1N6872: LED1.2(A) R135.1
$1N7719: D36.2(K) R135.2 U41.2
$1N7746: U41.1 U48.2
$1N7753: R157.2 U42.5(FB) U48.1
$1N8544: C238.2 U44.1(BOOT)
$1N8547: C249.1 C250.2 C256.1 D37.2(K) D38.2 R160.2 U44.2(VIN) U44.3(EN) U44.4(RT/CLK)
$1N8548: R162.1 U44.6(COMP)
$1N8549: C237.2 R162.2
$1N8557: C238.1 L4.1 U44.8(SW)
$1N8558: LED2.2(A) R163.1
$1N8576: R165.2(BOT) R165.ADJ R179.1
$1N8578: R165.1(TOP) R180.2 U44.5(FB)
$1N11927: CN1.3 R167.1
$1N19694: CN4.3 R170.1
$1N19699: CN3.3 R169.1
$1N19704: CN2.3 R168.1
$1N30078: H28.5 R173.2
$1N30080: H28.1 R171.1
$1N30082: H28.2 R172.1
$1N30084: H28.6 R174.2
$1N30095: H29.5 R175.2
$1N30097: H29.1 R177.1
$1N30099: H29.6 R176.2
$1N30101: H29.2 R178.1
Net-(C258-1): C258.1 L5.2 U12.7

Not connected (* = marked no-connect by the designer): 1 4(NC)*; CN1 2; CN2 2; CN3 2; CN4 2; CN5 3; H28 3 4; H29 3 4; L6 1 2; P1 5(Z) 6(NC); P14 5* 19* 20*; P15 5(Z) 6(NC); U10 4(NC)*; U12 2*; U28 1 2; U45 1(A) 2(B) 3(GND) 4(Y) 5(VCC); U46 1(DI0) 2(DI1) 3(DI2) 4(DI3) 5(WE) 6(GND1) 7(TST) 8(WRST) 9(WCK) 10(VDD) 11(DI4) 12(DI5) 13(DI6) 14(DI7) 15(DO7) 16(DO6) 17(DO5) 18(DO4) 19(DEC) 20(RCK) 21(RRST) 22(OE) 23(GND2) 24(RE) 25(DO3) 26(DO2) 27(DO1) 28(DO0); U51 A1(VCC5V) A2(GND) A3(VCC5V) A4(GND) A5(VCC5V) A6(GND) A7(PK10) A8(PK11) A9(PK8) A10(PK9) A11(PK6) A12(PK7) A13(PK4) A14(PK5) A15(PK2) A16(PK3) A17(PK0) A18(PK1) A19(PI8) A20(PI9) A21(PD12) A22(PD13) A23(PG3) A24(PG4) A25(PG1) A26(PG2) A27(PE4) A28(PG0) A29(PE2) A30(PE3) A31(PE0) A32(PE1) A33(PL6) A34(PL7) A35(PL3) A36(PL5) A37(PC1) A38(PC0) A39(PC3) A40(PC2) A41(PC5) A42(PC4) A43(PC7) A44(PC6) A45(PC9) A46(PC8) A47(PD15) A48(PD14) A49(PH13) A50(PH12) A51(PH15) A52(PH14) A53(PF3) A54(PF2) A55(PF5) A56(PF4) A57(PC11) A58(PC10) A59(PC13) A60(PC12) B1(PI1) B2(PI0) B3(PI3) B4(PI2) B5(PI5) B6(PI4) B7(PI7) B8(PI6) B9(PG6) B10(PG5) B11(PG8) B12(PG7) B13(PG10) B14(PG9) B15(PG12) B16(PG11) B17(PE14) B18(PE15) B19(PD11) B20(PE13) B21(PB15) B22(PB14) B23(PB13) B24(PB12) B25(PB7) B26(PB6) B27(PB5) B28(PB4) B29(PB3) B30(PB2) B31(PB1) B32(PB0) B33(PI13) B34(PI12) B35(PI11) B36(PI10) B37(PF1) B38(PF0) B39(PD10) B40(PD9) B41(PD8) B42(PL14) B43(PL12) B44(PL10) B45(PB11) B46(PB10) B47(PB9) B48(PB8) B49(PF7) B50(PF6) B51(PJ1) B52(PJ0) B53(PJ3) B54(PJ2) B55(PJ6) B56(PJ4) B57(PJ9) B58(PJ8) B59(PJ11) B60(PJ10) C1(PC15) C2(PC14) C3(PM1) C4(PM0) C5(PM3) C6(PM2) C7(PM5) C8(PM4) C9(PM7) C10(PM6) C11(PM9) C12(PM8) C13(PK14) C14(PM10) C15(PD0) C16(PK15) C17(PD2) C18(PD1) C19(PH2) C20(PD3) C21(PH4) C22(PH3) C23(PH8) C24(PH7) C25(PH10) C26(PH9) C27(PE11) C28(PE12) C29(PA10) C30(PE10) C31(PA12) C32(PA11) C33(PA0) C34(PA13) C35(PA2) C36(PA1) C37(PE8) C38(PE9) C39(PE6) C40(PE7) C41(PH11) C42(PE5) C43(PG14) C44(PG13) C45(PD5) C46(PD4) C47(PD7) C48(PD6) C49(PI14) C50(PI15) C51(PK12) C52(PK13) C53(PF14) C54(PF15) C55(PF12) C56(PF13) C57(PF10) C58(PF11) C59(PF8) C60(PF9)

## Notes on the sheet
- 编码器
- 电调
- 电机
- 3V3电源
- 屏幕供电
- 蜂鸣器
- RTK
- IMU
- 屏幕接口
- 摄像头供电
- 无线串口
- 按键和拨码开关
- 电源接口
- 电压检测
- 摄像头
